# Altium schematic sheet Controller-Sheet-3.SchDoc
size A4; SheetNumber: 4; SheetTotal: 9
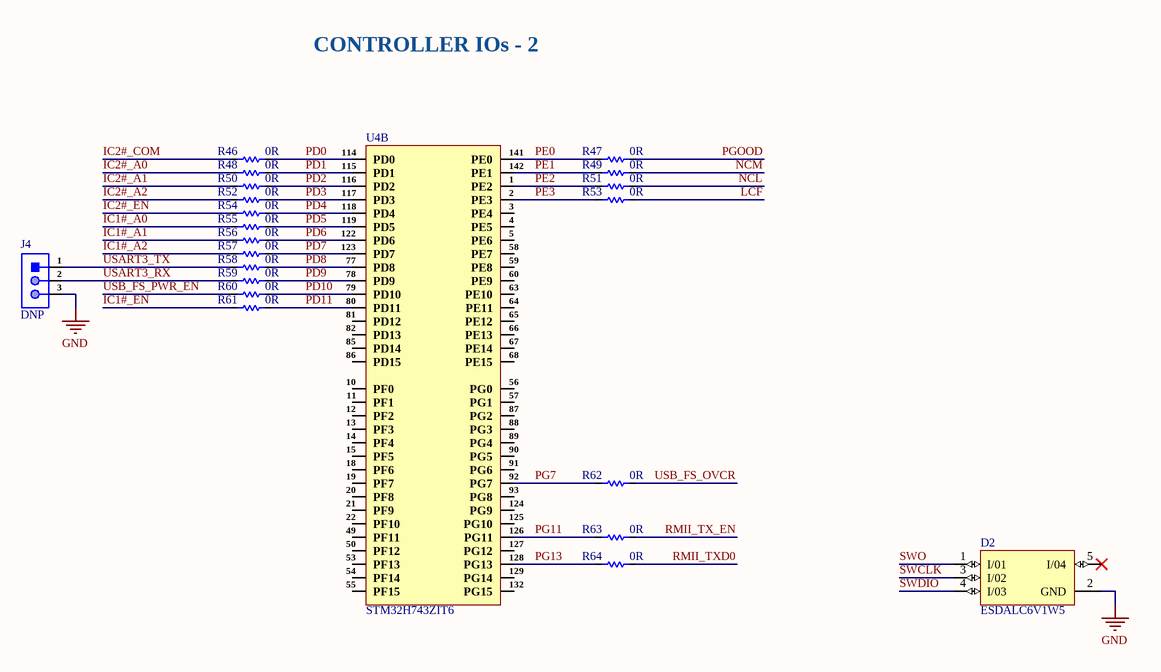
[diagram p0: Controller-Sheet-3.SchDoc]

## Parts
D2  ESDALC6V1W5  [SOT65P210X110-5N]
J4  DNP  [HDR1X3_]
R46  0R  [Res-0402]
R47  0R  [Res-0402]
R48  0R  [Res-0402]
R49  0R  [Res-0402]
R50  0R  [Res-0402]
R51  0R  [Res-0402]
R52  0R  [Res-0402]
R53  0R  [Res-0402]
R54  0R  [Res-0402]
R55  0R  [Res-0402]
R56  0R  [Res-0402]
R57  0R  [Res-0402]
R58  0R  [Res-0402]
R59  0R  [Res-0402]
R60  0R  [Res-0402]
R61  0R  [Res-0402]
R62  0R  [Res-0402]
R63  0R  [Res-0402]
R64  0R  [Res-0402]
U4  STM32H743ZIT6  [LQFP-144(20x20)]  (part B of 3)

## Nets
GND: D2.2(GND) J4.3
IC1#_A0: R55.2
IC1#_A1: R56.2
IC1#_A2: R57.2
IC1#_EN: R61.2
IC2#_A0: R48.2
IC2#_A1: R50.2
IC2#_A2: R52.2
IC2#_COM: R46.2
IC2#_EN: R54.2
LCF: R53.1
NCL: R51.1
NCM: R49.1
PD0: R46.1 U4.114(PD0)
PD1: R48.1 U4.115(PD1)
PD2: R50.1 U4.116(PD2)
PD3: R52.1 U4.117(PD3)
PD4: R54.1 U4.118(PD4)
PD5: R55.1 U4.119(PD5)
PD6: R56.1 U4.122(PD6)
PD7: R57.1 U4.123(PD7)
PD8: R58.1 U4.77(PD8)
PD9: R59.1 U4.78(PD9)
PD10: R60.1 U4.79(PD10)
PD11: R61.1 U4.80(PD11)
PE0: R47.2 U4.141(PE0)
PE1: R49.2 U4.142(PE1)
PE2: R51.2 U4.1(PE2)
PE3: R53.2 U4.2(PE3)
PG7: R62.2 U4.92(PG7)
PG11: R63.2 U4.126(PG11)
PG13: R64.2 U4.128(PG13)
PGOOD: R47.1
RMII_TX_EN: R63.1
RMII_TXD0: R64.1
SWCLK: D2.3(I/02)
SWDIO: D2.4(I/03)
SWO: D2.1(I/01)
USART3_RX: J4.2 R59.2
USART3_TX: J4.1 R58.2
USB_FS_OVCR: R62.1
USB_FS_PWR_EN: R60.2

Not connected (* = marked no-connect by the designer): D2 5(I/04)*; U4 3(PE4) 4(PE5) 5(PE6) 10(PF0) 11(PF1) 12(PF2) 13(PF3) 14(PF4) 15(PF5) 18(PF6) 19(PF7) 20(PF8) 21(PF9) 22(PF10) 49(PF11) 50(PF12) 53(PF13) 54(PF14) 55(PF15) 56(PG0) 57(PG1) 58(PE7) 59(PE8) 60(PE9) 63(PE10) 64(PE11) 65(PE12) 66(PE13) 67(PE14) 68(PE15) 81(PD12) 82(PD13) 85(PD14) 86(PD15) 87(PG2) 88(PG3) 89(PG4) 90(PG5) 91(PG6) 93(PG8) 124(PG9) 125(PG10) 127(PG12) 129(PG14) 132(PG15)

## Notes on the sheet
- CONTROLLER IOs - 2
- File:
- Title:
- Date:
- Page
- Num:
- Total:
- Drawn By: Huzaifa Ali

## Library data of the parts
D2 = ESDALC6V1W5: - Clamp - Ipp Tvs Diode Surface Mount SOT-323-5; MF: STMicroelectronics; SnapEDA_Link: https://www.snapeda.com/parts/ESDALC6V1W5/STMicroelectronics/view-part/?ref=snap; Package: SOT-323 STMicroelectronics; Value: *; MP: ESDALC6V1W5; Check_prices: https://www.snapeda.com/parts/ESDALC6V1W5/STMicroelectronics/view-part/?ref=eda
J4 = X6511WV-03H-C60D30: Gold 250V 3A Straight Square Pins 2.5mm 3P 260℃ 6mm -40℃~+105℃ 3mm 2.54mm Plugin Black Brass 1x3P Plugin,P=2.54mm Pin Headers ROHS; Manufacturer: XKB; Item Type: Male Header; Manufacturer Part Number: X6511WV-03H-C60D30; Package: Plugin,P=2.54mm; LCSC Part Number: C706875; ComponentLink1Description: LCSC; ComponentLink1URL: https://www.lcsc.com/product-detail/Pin-Headers_XKB-Connectivity-X6511WV-03H-C60D30_C706875.html
R46-R64 = RC0402FR-070RL: RES 0 OHM JUMPER 1/16W 0402; Manufacturer: Yageo; Item Type: Resistors; Tolerance: 1%; Power Rating: 62.5mW; Voltage Rating: 50V; Temperature Coefficient: 200ppm/°C; Max Power Dissipation: 63mW; Supplier 1: Mouser; Manufacturer Part Number: RC0402FR-070RL; RoHS: Yes; Stock 1: 8556842; Pricing 1: 1=0.10000, 10=0.01400, 50=0.01400, 100=0.00600, 1000=0.00300, 5000=0.00200, 10000=0.00100 (USD); Mount: Surface Mount; Case/Package: 0402; Contact Plating: Tin,Matte; Case Code (Imperial): 0402; Case Code (Metric): 1005; Size Code: 0402; Min Operating Temperature: -55°C; Max Operating Temperature: 155°C; Resistance: 0R; Resistor Type: Thick Film; Packaging: Tape and Reel; Termination: SMD/SMT; Features: Moisture Resistant; Series: RC; Number of Terminations: 2; Length: 1mm; Width: 0.5mm; Height: 0.35mm; Radiation Hardening: No; Lead Free: Lead Free; RoHS Compliant: Yes; ComponentLink1URL: https://datasheet.ciiva.com/8896/pyu-rc0402-51-rohs-l-6-8896149.pdf?src-supplier=Avnet; ComponentLink1Description: https://datasheet.ciiva.com/8896/pyu-rc0402-51-rohs-l-6-8896149.pdf?src-supplier=Avnet; ComponentLink2URL: https://datasheet.ciiva.com/16790/pyu-rc0402-51-rohs-l-6-r-16790444.pdf?src-supplier=Future+Electronics; ComponentLink2Description: https://datasheet.ciiva.com/16790/pyu-rc0402-51-rohs-l-6-r-16790444.pdf?src-supplier=Future+Electronics; Supplier Part Number 1: 603-RC0402FR-070RL; LCSC Part Number: C106231
U4 = STM32H743ZIT6: IC MCU 32BIT 2MB FLASH 144LQFP; Manufacturer: STMicroelectronics; Nominal Supply Current: 4uA; Number of A/D Converters: 2NUMBER; Number of Channels: 28NUMBER; Number of I2C Channels: 4NUMBER; Number of SPI Channels: 6NUMBER; Supplier: Future Electronics; LCSC Part Number: C114408; Manufacturer Part Number: STM32H743ZIT6; RoHS: Yes; Item Type: IC; Stock: 12840; Pricing: 60=10.13, 120=10.07, 180=10.04, 240=10.02, 300=9.95 (USD); Density: 2MB; Number of D/A Converters: 2NUMBER; Number of PWM Channels: 2NUMBER; Number of Timers/Counters: 2NUMBER; Number of UART Channels: 4NUMBER; Number of USB Channels: 2NUMBER; Height: 1.6mm; ComponentLink1URL: https://datasheet.ciiva.com/68216/2551152-68216837.pdf?src-supplier=Farnell; ComponentLink1Description: https://datasheet.ciiva.com/68216/2551152-68216837.pdf?src-supplier=Farnell